# Altium schematic sheet Sheet_1_2024-07-17.schdoc
size C
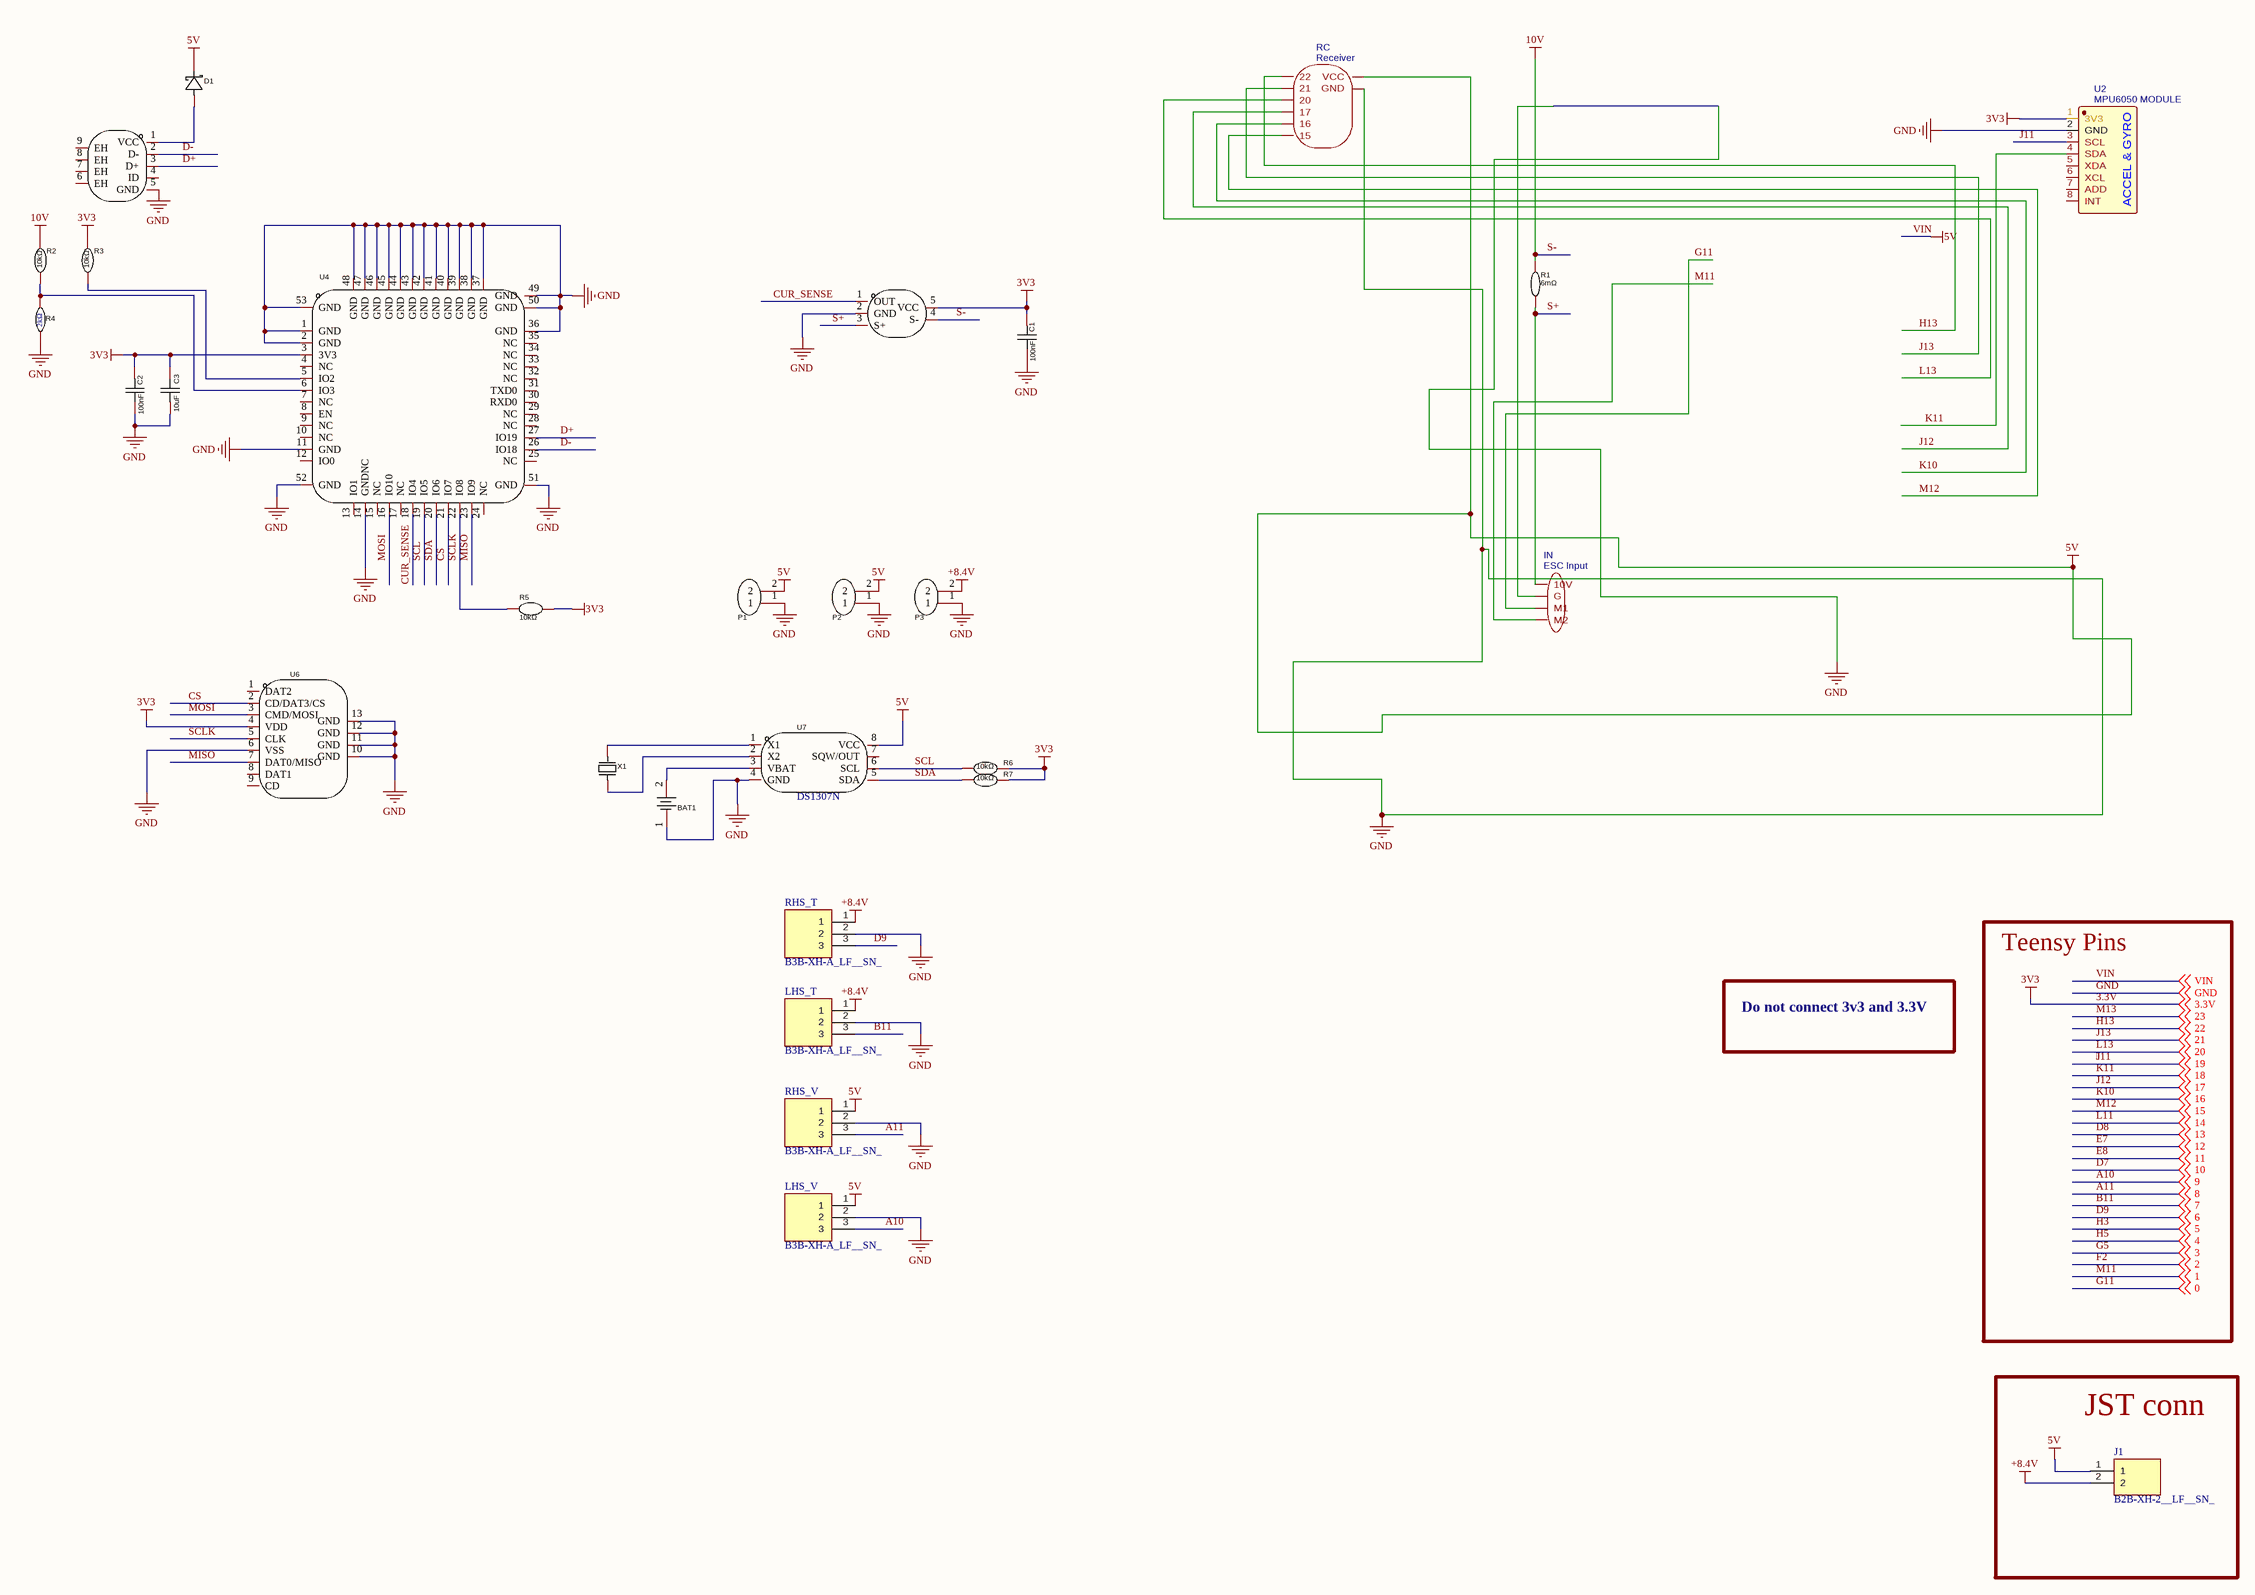
[diagram p0: Sheet_1_2024-07-17.schdoc]

## Parts
BAT1  BS-CR2032-8  [BAT-SMD_BS-CR2032-8]  (value not drawn)
C1  value 100nF  [C0402]  (hidden comment: 0402B104K250CT)
C2  value 100nF  [C0402]  (hidden comment: 0402B104K250CT)
C3  value 10uF  [C0402]  (hidden comment: 0402X106M6R3NT)
D1  SS34-MS  [DO-214AC_L4.3-W2.7-LS5.0-RD]  (value not drawn)
IN  ESC Input  [PINS1X4]
J1  B2B-XH-2__LF__SN_  [B2BXH2LFSN]
LHS_T  B3B-XH-A_LF__SN_  [B3BXHALFSN]
LHS_V  B3B-XH-A_LF__SN_  [B3BXHALFSN]
P1  C18185649  [HDR-TH_2P-P2.50-V-F-1]  (value not drawn)
P2  C18185649  [HDR-TH_2P-P2.50-V-F-1]  (value not drawn)
P3  C18185649  [HDR-TH_2P-P2.50-V-F-1]  (value not drawn)
R1  value 6mΩ  [R0805]  (hidden comment: RLM10FTSMR006)
R2  value 10kΩ  [R0402]  (hidden comment: SCR0402F10K)
R3  value 10kΩ  [R0402]  (hidden comment: SCR0402F10K)
R4  value 2kΩ  [R0402]  (hidden comment: RMC04022K1%N)
R5  value 10kΩ  [R0402]  (hidden comment: SCR0402F10K)
R6  value 10kΩ  [R0402]  (hidden comment: SCR0402F10K)
R7  value 10kΩ  [R0402]  (hidden comment: SCR0402F10K)
RC  Receiver  [HEADER_PINS_3X6_2.54MM]
RHS_T  B3B-XH-A_LF__SN_  [B3BXHALFSN]
RHS_V  B3B-XH-A_LF__SN_  [B3BXHALFSN]
U2  MPU6050 MODULE  [MPU6050]
U3  HX MICRO XNJ JB  [MICRO-USB-SMD_MICRONJ5P-1.0-1.25]  (value not drawn)
U4  ESP32-C3-MINI-1U-H4  [WIFIM-SMD_ESP32-C3-MINI-MINI-1U]  (value not drawn)
U5  ZXCT1086E5TA  [SOT-25_L3.0-W1.6-P0.95-LS2.8-BR]  (value not drawn)
U6  HX TF-CARD H1.8  [TF-SMD_HX-TF-CARD-H1.8]  (value not drawn)
U7  DS1307N  [DIP-8_L9.8-W6.6-P2.54-LS7.6-BL]
X1  DT-26 32.768KHz  [OSC-TH_BD2.0-P0.70-D0.3]  (value not drawn)

## Blocks framed on the sheet
JST conn: J1

## Nets
3.3V: C1.2 C2.2 C3.1 R3.2 R5.2 R6.2 R7.2 U2.1(3V3) U4.3(3V3) U5.5(VCC) U6.4(VDD) ; off-sheet 3.3V  [also labelled 3V3]
+8.4V: J1.2 LHS_T.1 P3.2 RHS_T.1
GND: BAT1.1 C1.1 C2.1 C3.2 IN.2(G) LHS_T.2 LHS_V.2 P1.1 P2.1 P3.1 R4.1 RC.10(GND) RHS_T.2 RHS_V.2 U2.2(GND) U3.5(GND) U4.1(GND) U4.2(GND) U4.11(GND) U4.14(GNDNC) U4.36(GND) U4.37(GND) U4.38(GND) U4.39(GND) U4.40(GND) U4.41(GND) U4.42(GND) U4.43(GND) U4.44(GND) U4.45(GND) U4.46(GND) U4.47(GND) U4.48(GND) U4.49(GND) U4.50(GND) U4.51(GND) U4.52(GND) U4.53(GND) U5.2(GND) U6.6(VSS) U6.10(GND) U6.11(GND) U6.12(GND) U6.13(GND) U7.4(GND) ; off-sheet GND
S-: R1.2 R2.2 U5.4(S-)  [also labelled 10V]
VIN: D1.1(A) J1.1 LHS_V.1 P1.2 P2.2 RC.9(VCC) RHS_V.1 U7.8(VCC) ; off-sheet VIN  [also labelled 5V]
: U2.3(SCL) ; off-sheet 19  [also labelled 19, J11]
A10: LHS_V.3 ; off-sheet 9  [also labelled 9]
A11: RHS_V.3 ; off-sheet 8  [also labelled 8]
B11: LHS_T.3 ; off-sheet 7  [also labelled 7]
CS: U4.21(IO7) U6.2(CD/DAT3/CS)
CUR_SENSE: U4.18(IO4) U5.1(OUT)
D9: RHS_T.3 ; off-sheet 6  [also labelled 6]
D+: U3.3(D+) U4.27(IO19)
D-: U3.2(D-) U4.26(IO18)
G11: IN.3(M1) ; off-sheet 0  [also labelled 0]
H13: RC.1(22) ; off-sheet 22  [also labelled 22]
J12: RC.4(17) ; off-sheet 17  [also labelled 17]
J13: RC.2(21) ; off-sheet 21  [also labelled 21]
K10: RC.5(16) ; off-sheet 16  [also labelled 16]
K11: U2.4(SDA) ; off-sheet 18  [also labelled 18]
L13: RC.3(20) ; off-sheet 20  [also labelled 20]
M11: IN.4(M2) ; off-sheet 1  [also labelled 1]
M12: RC.6(15) ; off-sheet 15  [also labelled 15]
MISO: U4.23(IO9) U6.7(DAT0/MISO)
MOSI: U4.16(IO10) U6.3(CMD/MOSI)
S+: IN.1(10V) R1.1 U5.3(S+)
SCL: R6.1 U4.19(IO5) U7.6(SCL)
SCLK: R5.1 U4.22(IO8) U6.5(CLK)
SDA: R7.1 U4.20(IO6) U7.5(SDA)
NetBAT1_2: BAT1.2 U7.3(VBAT)
NetD1_2: D1.2(K) U3.1(VCC)
NetR2_1: R2.1 R4.2 U4.6(IO3)
NetR3_1: R3.1 U4.5(IO2)
NetU7_1: U7.1(X1) X1.1(OSC1)
NetU7_2: U7.2(X2) X1.2(OSC2)

Not connected (* = marked no-connect by the designer): U2 5(XDA) 6(XCL) 7(ADD) 8(INT); U3 4(ID) 6(EH) 7(EH) 8(EH) 9(EH); U4 4(NC) 7(NC) 8(EN) 9(NC) 10(NC) 12(IO0) 13(IO1) 15(NC) 17(NC) 24(NC) 25(NC) 28(NC) 29(NC) 30(RXD0) 31(TXD0) 32(NC) 33(NC) 34(NC) 35(NC); U6 1(DAT2) 8(DAT1) 9(CD); U7 7(SQW/OUT)

## Notes on the sheet
- Teensy Pins
- Do not connect 3v3 and 3.3V
- (in symbol MPU6050 MODULE) ACCEL & GYRO

## Library data of the parts
BAT1 = BS-CR2032-8: Manufacturer: LX(连欣科技); Add into BOM: yes; Connector Type: Battery base; Battery Type: CR2032; Symbol: BS-CR2032-8; Device: BS-CR2032-8; LCSC Part Name: 电池座 CR2032-BS-8贴片式 电池底座; Supplier Part: C7498149; Manufacturer Part: BS-CR2032-8; Supplier Footprint: SMD; JLCPCB Part Class: Extended Part; Datasheet: https://atta.szlcsc.com/upload/public/pdf/source/20230925/275539F3265A587241B200E8332449D9.pdf; Supplier: LCSC; Convert to PCB: yes; Contact Material: 铜端; Contact Plating: Gold; Operating Temperature Range: -40℃~+85℃; JLC part: C7498149
C1 C2 = 0402B104K250CT: Manufacturer: Walsin(华新科); Add into BOM: yes; Tolerance: ±10%; Symbol: 0402B104K250CT; Device: 0402B104K250CT; LCSC Part Name: 100nF ±10% 25V; Supplier Part: C301930; Manufacturer Part: 0402B104K250CT; Supplier Footprint: 0402; JLCPCB Part Class: Extended Part; Datasheet: https://atta.szlcsc.com/upload/public/pdf/source/20191217/C469650_84AD5C6F618CF4AC0C6D987F2E8FE6F8.pdf; Supplier: LCSC; Convert to PCB: yes
C3 = 0402X106M6R3NT: Manufacturer: FH(风华); Add into BOM: yes; Tolerance: ±20%; Symbol: 0402X106M6R3NT; Device: 0402X106M6R3NT; LCSC Part Name: 10uF ±20% 6.3V; Supplier Part: C163694; Manufacturer Part: 0402X106M6R3NT; Supplier Footprint: 0402; JLCPCB Part Class: Extended Part; Datasheet: https://atta.szlcsc.com/upload/public/pdf/source/20220211/3FDF6092789FC56E23A16E03DC7301F9.pdf; Supplier: LCSC; Convert to PCB: yes
D1 = SS34-MS: Manufacturer: MSKSEMI(美森科); Add into BOM: yes; Forward Voltage (Vf@If): 550mV@3A; Reverse Voltage (Vr): 40V; Rectified Current: 3A; Reverse Leakage Current (Ir): 500uA@40V; Symbol: SS34-MS; Device: SS34-MS; LCSC Part Name: 电压:40V 电流:3A; Supplier Part: C2836396; Manufacturer Part: SS34-MS; Supplier Footprint: SMA(DO-214AC); JLCPCB Part Class: Extended Part; Datasheet: https://atta.szlcsc.com/upload/public/pdf/source/20231010/B8429D209A8A83BAE11971393C9E7848.pdf; Supplier: LCSC; Convert to PCB: yes; Diode Configuration: -; JLC part: C2836396
IN = ESC Input: Manufacturer: null; Contributor: LCSC; Supplier Part: C721444; spicePre: J; spiceSymbolName: HEADER-4
J1 = B2B-XH-2__LF__SN_: Connector; Manufacturer_Name: JST (JAPAN SOLDERLESS TERMINALS); Manufacturer_Part_Number: B2B-XH-2 (LF)(SN); Datasheet Link: http://uk.rs-online.com/web/p/products/1755297; Height: 7mm; Arrow Part Number: B2B-XH-2 (LF)(SN); Arrow Price/Stock: https://www.arrow.com/en/products/b2b-xh-2-lf-sn/jst-manufacturing?region=europe
LHS_T LHS_V RHS_T RHS_V = B3B-XH-A_LF__SN_: Connector; Manufacturer_Name: JST (JAPAN SOLDERLESS TERMINALS); Manufacturer_Part_Number: B3B-XH-A(LF)(SN); Datasheet Link: https://datasheet.lcsc.com/szlcsc/1812131720_JST-Sales-America-B3B-XH-A-LF-SN_C144394.pdf; Height: 7mm; Arrow Part Number: B3B-XH-A(LF)(SN); Arrow Price/Stock: https://www.arrow.com/en/products/b3b-xh-a-lf-sn/jst-manufacturing; JLC part: C144394
P1-P3 = WJ500V-5.08-2P: Manufacturer: KANGNEX(康奈克斯电气); Add into BOM: yes; Structure: 1x2P; Pitch: 5.08mm; Current Rating (Max): 18A; Voltage Rating (Max): 250V; Wire Gauge - AWG: 14~30; Wire Gauge - mm2: 2.5; Number of PINs Per Row: 2; Screw Specification: M2.5; Symbol: C18185649; Device: C18185649; LCSC Part Name: C18185649; Supplier Part: C18185649; Manufacturer Part: WJ500V-5.08-2P; Supplier Footprint: 插件,P=5.08mm; JLCPCB Part Class: Extended Part; Datasheet: https://atta.szlcsc.com/upload/public/pdf/source/20191225/C8465_02D34CE5B5B4A53DF5891601D97FA9F4.pdf; Supplier: LCSC; Convert to PCB: yes; Color: Green; Mounting Style: Straight; Number of Pins: 2P; Number of Rows: 1; Contact Material: -; Contact Plating: -; Operating Temperature Range: -40℃~+105℃; Soldering Temperature(Max): -
R1 = RLM10FTSMR006: Manufacturer: 大毅科技; Add into BOM: yes; Tolerance: ±1%; Temperature Coefficient: ±50ppm/℃; Symbol: RLM10FTSMR006; Device: RLM10FTSMR006; LCSC Part Name: 6mΩ ±1% 500mW; Supplier Part: C163092; Manufacturer Part: RLM10FTSMR006; Supplier Footprint: 0805; JLCPCB Part Class: Extended Part; Datasheet: https://atta.szlcsc.com/upload/public/pdf/source/20190621/C393099_0FB28B25F89EBDFD36A063D527AB5378.pdf; Supplier: LCSC; Convert to PCB: yes
R2 R3 R5-R7 = SCR0402F10K: Manufacturer: VO(翔胜); Add into BOM: yes; Tolerance: ±1%; Symbol: SCR0402F10K; Device: SCR0402F10K; LCSC Part Name: 厚膜电阻 10kΩ ±1% 62.5mW; Supplier Part: C3015825; Manufacturer Part: SCR0402F10K; Supplier Footprint: 0402; JLCPCB Part Class: Extended Part; Datasheet: https://atta.szlcsc.com/upload/public/pdf/source/20220513/247AF9639BA21CF93567DC289CCC6A22.pdf; Supplier: LCSC; Convert to PCB: yes; Type: Thick Film Resistors; Operating Temperature Range: -55℃~+155℃
R4 = RMC04022K1%N: Manufacturer: Tyohm(幸亚电阻); Add into BOM: yes; Tolerance: ±1%; Symbol: RMC04022K1%N; Device: RMC04022K1%N; Supplier: LCSC; Supplier Part: C325372; Manufacturer Part: RMC04022K1%N; JLCPCB Part Class: Extended Part; LCSC Part Name: 2kΩ ±1% 62.5mW; Supplier Footprint: 0402; Datasheet: https://atta.szlcsc.com/upload/public/pdf/source/20190115/C325956_D27151D492FFB3C9AB4A6F14FE01F30A.pdf; Convert to PCB: yes
RC = Receiver: Contributor: vblucifer; sourceId: HEyQK2kew; timeStamp: 1459993546; Supplier Part: C5967361; spicePre: H; spiceSymbolName: HEADER_PINS_3X6_2.54MM
U2 = MPU6050 MODULE: Contributor: jofenix; Manufacturer Part: MPU6050; Supplier: Aliexpress; spicePre: U; spiceSymbolName: MPU6050 MODULE
U3 = HX MICRO XNJ JB: Manufacturer: hanxia(韩下); Add into BOM: yes; Connector Type: Micro-B; Gender: Female; Symbol: HX MICRO XNJ JB; Device: HX MICRO XNJ JB; LCSC Part Name: Micro-B 母; Supplier Part: C5160305; Manufacturer Part: HX MICRO XNJ JB; Supplier Footprint: SMD; JLCPCB Part Class: Extended Part; Datasheet: https://atta.szlcsc.com/upload/public/pdf/source/20220913/52645552CAE40EE2821654B8B5D78998.pdf; Supplier: LCSC; Convert to PCB: yes; JLC part: C5160305
U4 = ESP32-C3-MINI-1U-H4: Manufacturer: ESPRESSIF(乐鑫); Add into BOM: yes; Symbol: ESP32-C3-MINI-1U-H4; Device: ESP32-C3-MINI-1U-H4; LCSC Part Name: ESP32-C3-MINI-1U-H4; Supplier Part: C3013922; Manufacturer Part: ESP32-C3-MINI-1U-H4; Supplier Footprint: SMD,12.5x13.2mm; JLCPCB Part Class: Extended Part; Datasheet: https://atta.szlcsc.com/upload/public/pdf/source/20220602/2F3F799AD033675D9930B69B0B580EA8.pdf; Supplier: LCSC; Convert to PCB: yes; JLC part: C3013922
U5 = ZXCT1086E5TA: Manufacturer: DIODES(美台); Add into BOM: yes; Supply Voltage: 2.7V~60V; Symbol: ZXCT1086E5TA; Device: ZXCT1086E5TA; LCSC Part Name: ZXCT1086E5TA; Supplier Part: C154866; Manufacturer Part: ZXCT1086E5TA; Supplier Footprint: SOT-25; JLCPCB Part Class: Extended Part; Datasheet: https://atta.szlcsc.com/upload/public/pdf/source/20191127/C460628_936E94C4C2CBD0D691B37544F3B74229.pdf; Supplier: LCSC; Convert to PCB: yes; Operating Temperature: -40℃~+125℃
U6 = HX TF-CARD H1.8: Manufacturer: hanxia(韩下); Add into BOM: yes; Card Connection Mode: Self bomb; Card Type: MicroSD卡(TF卡); Connector Type: Deck; Maximum Body Height: 1.8mm; Symbol: HX TF-CARD H1.8; Device: HX TF-CARD H1.8; Supplier: LCSC; Supplier Part: C19189036; Manufacturer Part: HX TF-CARD H1.8; LCSC Part Name: 自弹式 MicroSD卡(TF卡) 卡座; Supplier Footprint: SMD; Datasheet: https://atta.szlcsc.com/upload/public/pdf/source/20231103/42D1E7AC2772CC1CF5ED366AE800D376.pdf; Convert to PCB: yes; Contact Material: Copper Alloy; Contact Plating: Gold; Operating Temperature Range: -40℃~+70℃; JLC part: C19189036
U7 = DS1307N: Manufacturer: HGSEMI(华冠); Add into BOM: yes; Symbol: DS1307N; Device: DS1307N; LCSC Part Name: DS1307N; Supplier Part: C434596; Manufacturer Part: DS1307N; Supplier Footprint: DIP-8; JLCPCB Part Class: Extended Part; Datasheet: https://atta.szlcsc.com/upload/public/pdf/source/20191028/C434596_A896F457AFB19CB3B73F60FA9E7EA7E6.pdf; Supplier: LCSC; Convert to PCB: yes; JLC part: C434596
X1 = DT-26 32.768KHz: Manufacturer: KDS(大真空); Add into BOM: yes; Symbol: DT-26 32.768KHz; Device: DT-26 32.768KHz; LCSC Part Name: 32.768KHz 12.5PF 20ppm; Supplier Part: C93229; Manufacturer Part: DT-26 32.768KHz; Supplier Footprint: DT-26; JLCPCB Part Class: Extended Part; Datasheet: https://atta.szlcsc.com/upload/public/pdf/source/20170103/1483440003252.pdf; Supplier: LCSC; Convert to PCB: yes; Crystal Type: -; Value: -; External load capacitor: -; Operating Temperature: -